# Altium schematic sheet UC3842原理图.SchDoc (part 2 of 2)
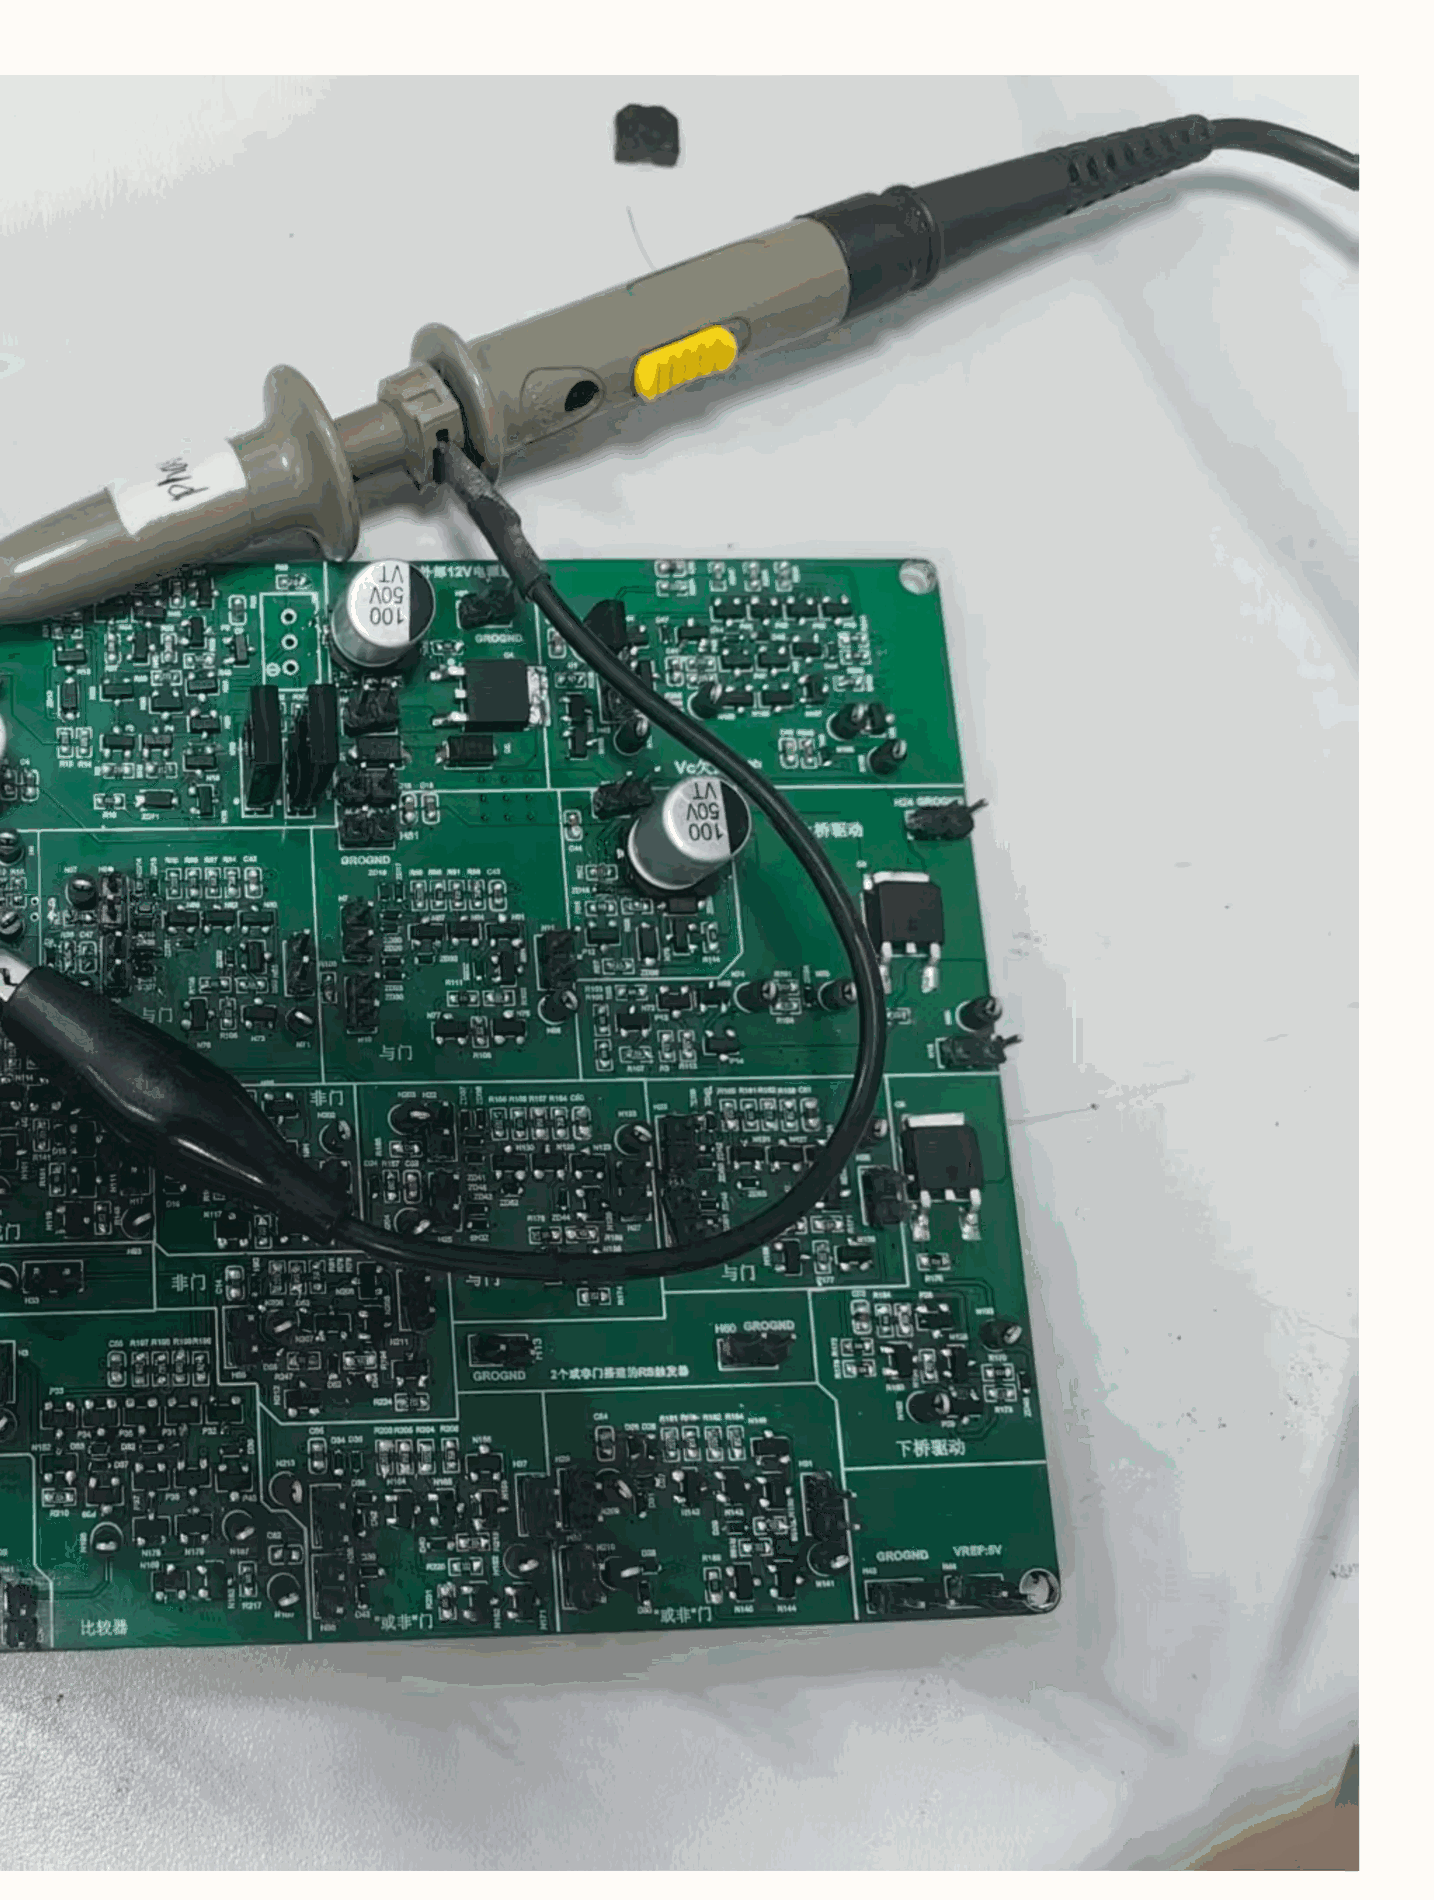
[diagram p10: UC3842原理图.SchDoc, bottom column 3 of 4]

## Nets
+VREF: C?#1.2 C?#2.2 C?#23.1 C?#24.1 C?#25.1 C?#27.2 C?#28.2 C?#31.2 C?#32.2 C?#33.2 C?#35.2 C?#36.2 C?#38.1 C?#39.2 C?#40.2 C?#46.2 C?#47.2 C?#48.2 C?#51.2 C?#52.2 C?#53.2 C?#54.2 C?#55.1 C?#56.1 C?#62.2 D?#5.2(K) D?#10.2(K) D?#11.2(K) D?#12.2(K) D?#13.2(K) D?#28.2(K) D?#29.2(K) D?#30.2(K) D?#42.2(K) D?#43.2(K) H?#1.1 H?#1.2 H?#16.2 H?#27.2 H?#57.2 H?#58.2 N?#74.3 N?#77.3 N?#78.3 N?#171.3 P?#21.2(E) P?#22.2(E) P?#45.2(E) Q?#9.2(E) R?#1.2 R?#2.2 R?#3.2 R?#4.2 R?#7.1 R?#8.2 R?#71.2 R?#72.2 R?#73.2 R?#74.2 R?#75.2 R?#76.2 R?#77.2 R?#79.2 R?#102.2 R?#103.2 R?#104.2 R?#105.2 R?#106.2 R?#107.2 R?#108.2 R?#109.2 R?#110.2 R?#111.2 R?#112.2 R?#113.2 R?#114.2 R?#115.2 R?#116.2 R?#117.2 R?#118.2 R?#119.2 R?#120.2 R?#121.2 R?#142.2 R?#143.2 R?#144.2 R?#145.2 R?#146.2 R?#148.2 R?#149.2 R?#150.2 R?#169.2 R?#170.2 R?#171.2 R?#172.2 R?#173.2 R?#174.2 R?#175.2 R?#176.1 R?#188.2 R?#190.2 R?#191.2 R?#192.2 R?#197.2 R?#198.2 R?#199.2 R?#200.2 R?#203.2 R?#204.2 R?#204.3 R?#209.1 R?#211.2 R?#212.2 U?#1.3(DRAIN) U?#2.3(DRAIN) ZD?#13.2(K) ZD?#14.2(K) ZD?#16.2(K) ZD?#17.2(K) ZD?#38.2(K) ZD?#39.2(K) ZD?#40.2(K) ZD?#41.2(K) ZD?#55.1(A) ZD?#62.2(K) ZD?#64.2(K)
COMP: C?#49.2 C?#50.2 COMP?#2.1 H?#9.1 H?#9.2 H?#48.1 N?#157.3 N?#160.3 N?#163.3 P?#36.3(C) R?#185.1 R?#186.1 ZD?#61.2(K)
GROGND: C?#1.1 C?#2.1 C?#3.2 C?#4.2 C?#7.2 C?#8.2 C?#9.2 C?#10.2 C?#11.2 C?#12.2 C?#13.2 C?#14.2 C?#15.2 C?#16.2 C?#17.2 C?#18.2 C?#20.2 C?#21.2 C?#22.2 C?#23.2 C?#24.2 C?#25.2 C?#27.1 C?#28.1 C?#29.1 C?#30.2 C?#31.1 C?#32.1 C?#33.1 C?#35.1 C?#36.1 C?#37.2 C?#38.2 C?#39.1 C?#40.1 C?#42.2 C?#44.1 C?#45.2 C?#46.1 C?#47.1 C?#48.1 C?#51.1 C?#52.1 C?#53.1 C?#54.1 C?#55.2 C?#56.2 C?#59.2 C?#60.2 C?#61.2 C?#62.1 D?#22.1(A) D?#23.1(A) D?#24.1(A) D?#25.1(A) D?#26.2(K) D?#37.1(A) D?#38.1(A) D?#39.1(A) D?#50.1(A) D?#51.1(A) H?#2.1 H?#2.2 H?#3.1 H?#3.2 H?#7.1 H?#7.2 H?#12.1 H?#12.2 H?#14.1 H?#14.2 H?#17.1 H?#17.2 H?#19.1 H?#19.2 H?#35.1 H?#35.2 H?#36.1 H?#36.2 H?#51.1 H?#51.2 N?#6.2 N?#8.2 N?#9.2 N?#13.2 N?#14.2 N?#24.2 N?#32.2 N?#39.2 N?#42.2 N?#43.2 N?#45.2 N?#48.2 N?#50.2 N?#67.2 N?#68.2 N?#70.2 N?#71.2 N?#84.2 N?#88.2 N?#99.2 N?#105.2 N?#106.2 N?#107.2 N?#108.2 N?#114.2 N?#116.2 N?#117.2 N?#119.2 N?#133.2 N?#134.2 N?#137.2 N?#138.2 N?#139.2 N?#149.2 N?#152.2 N?#153.2 N?#154.2 N?#161.2 N?#163.2 N?#175.2 N?#176.2 N?#179.2 N?#182.2 N?#184.2 N?#186.2 N?#187.2 N?#190.2 N?#192.2 N?#193.2 N?#195.2 N?#196.2 N?#199.2 P?#8.3(C) P?#9.3(C) P?#16.3(C) P?#17.3(C) P?#23.3(C) P?#29.3(C) P?#31.3(C) P?#32.3(C) P?#35.3(C) P?#46.3(C) P?#47.3(C) P?#48.3(C) Q?#3.2 Q?#4.2 Q?#6.3(S) R?#6.1 R?#10.1 R?#13.1 R?#47.1 R?#49.1 R?#54.1 R?#58.1 R?#59.1 R?#60.1 R?#63.1 R?#64.1 R?#65.1 R?#66.1 R?#67.1 R?#68.1 R?#69.1 R?#70.1 R?#94.2 R?#95.2 R?#127.1 R?#138.1 R?#139.1 R?#140.1 R?#141.1 R?#147.1 R?#152.1 R?#163.2 R?#165.1 R?#168.2 R?#179.2 R?#187.2 R?#195.2 R?#202.1 R?#205.1 R?#220.2 R?#221.2 R?#226.1 R?#227.1 R?#228.1 ZD?#9.2 ZD?#11.2 ZD?#12.2 ZD?#25.2(K) ZD?#26.1(A) ZD?#27.1(A) ZD?#29.1(A) ZD?#30.1(A) ZD?#31.2(K) ZD?#37.1(A) ZD?#49.2(K) ZD?#50.1(A) ZD?#51.1(A) ZD?#52.1(A) ZD?#53.1(A) ZD?#54.2(K) ZD?#60.2 ZD?#61.1(A) ZD?#63.1(A)
VC: C?#7.1 C?#8.1 C?#29.2 C?#44.2 D?#6.2(K) D?#7.2(K) H?#18.1 N?#15.1 N?#127.3 P?#34.2(E) R?#11.2 R?#18.2 R?#24.2 R?#151.1
VCC: C?#5.1 C?#6.1 C?#9.1 C?#10.1 H?#6.1 H?#6.2 N?#11.1 Q?#1.2(S) R?#23.2 R?#33.2 R?#36.2 ZD?#1.1 ZD?#2.1 ZD?#3.1
VFB: COMP?#3.1 H?#8.1 H?#8.2 N?#157.1 N?#158.2 R?#189.1
CUR: H?#58.1 R?#217.1
FAULT: C?#3.1 D?#5.1(A) H?#21.1 H?#38.1 N?#5.1 N?#8.3 R?#7.2 R?#9.1 ZD?#65.2(K)
Iout1: H?#5.2 N?#1.1
Iout2: H?#61.2 N?#162.1
ISENSES: H?#10.1 H?#10.2 N?#194.1 R?#218.2 R?#223.1
RT/CT: H?#54.1 N?#172.1
VOT: H?#57.1 R?#216.1
VOUT: C?#34.2 H?#4.1 H?#4.2 N?#72.2 N?#73.1 P?#20.3(C) Q?#5.3(S) Q?#6.2(D) R?#98.2 R?#99.1 R?#101.2 ZD?#32.2
NetC?#4_1: C?#4.1 D?#4.1(A) N?#7.1 P?#8.1(B) R?#11.1 R?#13.2
NetC?#5_2: C?#5.2 R?#12.2
NetC?#6_2: C?#6.2 D?#8.2(K) N?#26.1 P?#15.1(B) Q?#3.3 Q?#4.3 R?#36.1
NetC?#11_1: C?#11.1 N?#12.1 P?#10.3 Q?#1.3(D) R?#12.1 R?#19.2 ZD?#6.2(K) ZD?#8.2(K)
NetC?#12_1: C?#12.1 C?#13.1 C?#14.1 N?#10.1 N?#17.2(C) N?#19.2(C) R?#14.1 R?#15.1 R?#16.2 R?#17.2 R?#20.2 R?#21.2 R?#22.2
NetC?#15_1: C?#15.1 C?#16.1 H?#15.1 N?#22.2 N?#27.1 N?#31.3 R?#35.2 R?#37.2 R?#44.1 ZD?#6.1(A)
NetC?#17_1: C?#17.1 C?#18.1 N?#16.1 N?#20.2(C) N?#23.2(C) R?#18.1 R?#24.1 R?#25.2 R?#26.2 R?#29.2 R?#30.2 R?#31.2
NetC?#19_1: C?#19.1 N?#41.1 N?#44.3 R?#56.1
NetC?#19_2: C?#19.2 N?#41.3 N?#45.3 P?#16.1(B) R?#48.1
NetC?#20_1: C?#20.1 N?#36.1 Q?#3.1 R?#38.1 R?#58.2
NetC?#21_1: C?#21.1 N?#37.1 P?#15.3(C) Q?#4.1 R?#59.2
NetC?#22_1: C?#22.1 D?#8.1(A) N?#28.1 R?#33.1 ZD?#10.1
NetC?#26_1: C?#26.1 N?#47.1 N?#49.3 R?#62.1
NetC?#26_2: C?#26.2 N?#47.3 N?#50.3 P?#17.1(B) R?#53.1
NetC?#30_1: C?#30.1 D?#9.1(A) H?#22.1 N?#59.1 R?#86.1
NetC?#34_1: C?#34.1 P?#18.2(E) R?#82.2 ZD?#15.2(K)
NetC?#37_1: C?#37.1 N?#84.1 R?#124.2 R?#127.2
NetC?#41_1: C?#41.1 P?#32.1(B) ZD?#33.2(K) ZD?#36.1(A)
NetC?#41_2: C?#41.2 C?#43.2 R?#141.2 ZD?#37.2(K)
NetC?#42_1: C?#42.1 N?#92.1 N?#93.1 R?#118.1 R?#131.2
NetC?#43_1: C?#43.1 H?#34.1 H?#34.2
NetC?#45_1: C?#45.1 D?#27.1(A) H?#39.1 N?#128.1 R?#155.1
NetC?#49_1: C?#49.1 R?#189.2 R?#189.3
NetC?#50_1: C?#50.1 N?#158.1 N?#158.3 N?#159.1 N?#160.1 N?#195.3 Q?#8.3(C) ZD?#63.2(K)
NetC?#57_1: C?#57.1 N?#175.1 N?#180.3 N?#181.3 R?#208.1
NetC?#57_2: C?#57.2 N?#175.3 R?#207.1
NetC?#58_1: C?#58.1 N?#171.2
NetC?#58_2: C?#58.2 R?#219.2 R?#219.3
NetC?#59_1: C?#59.1 N?#183.1 R?#212.1 ZD?#64.1(A) ZD?#66.1
NetC?#60_1: C?#60.1 D?#49.2(K) N?#185.1 P?#45.3(C) R?#204.1 R?#227.2 ZD?#62.1(A) ZD?#65.1(A) ZD?#67.1(A) ZD?#68.1(A)
NetC?#61_1: C?#61.1 H?#59.2 H?#60.1 N?#191.1 R?#223.2
NetCOMP?#1_1: COMP?#1.1 P?#36.2(E) R?#176.2
NetD?#1_1: D?#1.1(A) P?#3.3(C)
NetD?#1_2: D?#1.2(K) D?#3.2(K) P?#6.1(B) P?#9.2(E)
NetD?#2_1: D?#2.1(A) P?#2.3(C)
NetD?#2_2: D?#2.2(K) D?#4.2(K) P?#7.1(B) P?#8.2(E)
NetD?#3_1: D?#3.1(A) N?#4.1 P?#9.1(B) R?#8.1 R?#9.2 R?#10.2
NetD?#6_1: D?#6.1(A) H?#13.1 H?#13.2 Q?#2.1(G) R?#47.2
NetD?#7_1: D?#7.1(A) Q?#2.2(D)
NetD?#9_2: D?#9.2(K) H?#32.2 H?#44.1 R?#81.2 R?#86.2
NetD?#10_1: D?#10.1(A) D?#21.2(K) D?#23.2(K) H?#33.2
NetD?#11_1: D?#11.1(A) D?#17.2(K) D?#24.2(K) H?#30.2
NetD?#12_1: D?#12.1(A) D?#14.2(K) D?#25.2(K) H?#28.2
NetD?#13_1: D?#13.1(A) D?#19.2(K) D?#22.2(K) H?#31.2 N?#90.1
NetD?#14_1: D?#14.1(A) N?#81.1 N?#112.1 R?#104.1
NetD?#15_1: D?#15.1 H?#30.1 N?#86.1 N?#88.3
NetD?#15_2: D?#15.2 R?#119.1
NetD?#16_1: D?#16.1(A) N?#80.2 N?#85.1 R?#129.2
NetD?#16_2: D?#16.2(K) D?#20.2(K) N?#80.1 N?#91.3 R?#113.1
NetD?#17_1: D?#17.1(A) N?#111.1 R?#109.1
NetD?#18_1: D?#18.1(A) N?#75.2 N?#82.1 R?#128.2
NetD?#18_2: D?#18.2(K) N?#75.1 N?#98.3 R?#106.1
NetD?#19_1: D?#19.1(A) N?#91.1 R?#112.1
NetD?#20_1: D?#20.1(A) H?#32.1 N?#85.2 N?#94.1 N?#106.3 R?#129.1
NetD?#21_1: D?#21.1(A) N?#103.1 N?#110.1 R?#110.1
NetD?#26_1: D?#26.1(A) N?#110.2 N?#111.2 N?#112.2
NetD?#27_2: D?#27.2(K) H?#45.2 R?#153.2 R?#155.2
NetD?#28_1: D?#28.1(A) D?#32.2(K) D?#37.2(K) H?#44.2 N?#143.1
NetD?#29_1: D?#29.1(A) D?#33.2(K) D?#39.2(K) H?#43.2 N?#145.1
NetD?#30_1: D?#30.1(A) D?#35.2(K) D?#38.2(K) H?#46.2 N?#147.1
NetD?#31_1: D?#31.1(A) N?#140.2 N?#141.1 R?#177.2
NetD?#31_2: D?#31.2(K) D?#34.2(K) N?#140.1 N?#144.3 R?#170.1
NetD?#32_1: D?#32.1(A) N?#144.1 R?#169.1
NetD?#33_1: D?#33.1(A) N?#150.1 R?#172.1
NetD?#34_1: D?#34.1(A) H?#45.1 N?#141.2 N?#149.3 R?#177.1
NetD?#35_1: D?#35.1(A) N?#151.1 R?#173.1
NetD?#36_1: D?#36.1(A) N?#142.2 N?#146.1 R?#178.1
NetD?#36_2: D?#36.2(K) N?#142.1 N?#150.3 N?#151.3 R?#174.1
NetD?#40_1: D?#40.1(A) P?#42.3(C)
NetD?#40_2: D?#40.2(K) D?#44.2(K) P?#43.1(B) P?#47.2(E)
NetD?#41_1: D?#41.1(A) P?#41.3(C)
NetD?#41_2: D?#41.2(K) D?#45.2(K) P?#44.1(B) P?#46.2(E)
NetD?#42_1: D?#42.1(A) D?#47.2(K) D?#51.2(K) H?#55.2
NetD?#43_1: D?#43.1(A) D?#46.2(K) D?#50.2(K) H?#53.2 N?#169.1
NetD?#44_1: D?#44.1(A) H?#49.2 N?#168.1 P?#47.1(B)
NetD?#45_1: D?#45.1(A) H?#59.1 N?#167.1 P?#46.1(B)
NetD?#46_1: D?#46.1(A) N?#177.1 R?#197.1
NetD?#47_1: D?#47.1(A) N?#178.1 R?#198.1
NetD?#48_1: D?#48.1(A) N?#166.2 N?#170.1 R?#213.1
NetD?#48_2: D?#48.2(K) N?#166.1 N?#177.3 N?#178.3 R?#199.1
NetD?#49_1: D?#49.1(A) P?#48.1(B)
NetH?#5_1: H?#5.1 N?#2.1 N?#3.1 N?#3.3 R?#5.1 U?#1.1(GATE)
NetH?#11_1: H?#11.1 P?#10.2 R?#27.2
NetH?#11_2: H?#11.2 R?#14.2 R?#15.2
NetH?#15_2: H?#15.2 Q?#2.3(S)
NetH?#16_1: H?#16.1 N?#25.2 N?#30.1 N?#35.3 R?#42.2 R?#43.2 R?#46.3 ZD?#8.1(A)
NetH?#18_2: H?#18.2 Q?#5.2(D) R?#78.2
NetH?#20_1: H?#20.1 N?#53.1 R?#81.1
NetH?#20_2: H?#20.2 ZD?#13.1(A) ZD?#18.2(K) ZD?#26.2(K)
NetH?#21_2: H?#21.2 ZD?#16.1(A) ZD?#19.2(K) ZD?#29.2(K)
NetH?#22_2: H?#22.2 ZD?#14.1(A) ZD?#20.2(K) ZD?#27.2(K)
NetH?#23_1: H?#23.1 N?#55.2 N?#67.3 R?#87.1
NetH?#23_2: H?#23.2 N?#61.1 R?#88.2
NetH?#24_1: H?#24.1 R?#88.1
NetH?#24_2: H?#24.2 ZD?#17.1(A) ZD?#22.2(K) ZD?#30.2(K)
NetH?#25_1: H?#25.1 N?#57.2 N?#63.1 N?#68.3 R?#90.1
NetH?#25_2: H?#25.2 R?#91.2
NetH?#26_1: H?#26.1 N?#69.1 N?#84.3 R?#117.1
NetH?#26_2: H?#26.2 H?#28.1 H?#43.1
NetH?#27_1: H?#27.1 N?#78.1
NetH?#29_1: H?#29.1 N?#77.2 N?#99.3 P?#28.2(E) R?#123.1
NetH?#29_2: H?#29.2 N?#83.1 R?#124.1
NetH?#31_1: H?#31.1 N?#82.2 N?#89.1 N?#107.3 R?#128.1
NetH?#33_1: H?#33.1 H?#47.2 H?#53.1
NetH?#37_1: H?#37.1 N?#122.1 R?#153.1
NetH?#37_2: H?#37.2 ZD?#38.1(A) ZD?#42.2(K) ZD?#50.2(K)
NetH?#38_2: H?#38.2 ZD?#40.1(A) ZD?#43.2(K) ZD?#52.2(K)
NetH?#39_2: H?#39.2 ZD?#39.1(A) ZD?#44.2(K) ZD?#51.2(K)
NetH?#40_1: H?#40.1 N?#124.2 N?#134.3 R?#156.1
NetH?#40_2: H?#40.2 N?#130.1 R?#157.2
NetH?#41_1: H?#41.1 R?#157.1
NetH?#41_2: H?#41.2 ZD?#41.1(A) ZD?#46.2(K) ZD?#53.2(K)
NetH?#42_1: H?#42.1 N?#126.2 N?#132.1 N?#137.3 R?#158.1
NetH?#42_2: H?#42.2 R?#159.2
NetH?#46_1: H?#46.1 H?#56.2
NetH?#47_1: H?#47.1 N?#146.2 N?#148.1 N?#153.3 R?#178.2
NetH?#48_2: H?#48.2 H?#50.1 N?#155.1 N?#187.3 P?#48.2(E) ZD?#58.1(A) ZD?#67.2(K)
NetH?#49_1: H?#49.1 N?#156.1 R?#184.1 R?#187.1 ZD?#60.1
NetH?#50_2: H?#50.2 P?#37.2(E) R?#193.2
NetH?#52_1: H?#52.1 H?#52.2 R?#194.2
NetH?#54_2: H?#54.2 N?#171.1
NetH?#55_1: H?#55.1 N?#173.1 N?#176.3 R?#211.1
NetH?#56_1: H?#56.1 N?#170.2 N?#174.1 N?#186.3 R?#213.2
NetH?#60_2: H?#60.2 R?#219.1
NetH?#61_1: H?#61.1 N?#197.1 N?#198.1 N?#198.3 R?#229.1 U?#2.1(GATE)
NetN?#1_2: N?#1.2 R?#6.2
NetN?#1_3: N?#1.3 P?#1.1(B) P?#2.1(B) P?#3.1(B) P?#4.1(B) P?#5.1(B) P?#5.3(C)
NetN?#3_2: N?#3.2 N?#6.1 N?#6.3
NetN?#8_1: N?#8.1 N?#9.3 P?#4.3(C)
NetN?#9_1: N?#9.1 N?#14.3 P?#6.3(C)
NetN?#13_1: N?#13.1 N?#13.3 N?#14.1 P?#7.3(C)
NetN?#17_1: N?#17.1(B) N?#22.3 N?#39.3 P?#12.3(C) P?#16.2(E) R?#48.2
NetN?#17_3: N?#17.3(E) N?#19.1(B) N?#19.3(E) R?#34.1 R?#35.1 R?#37.1
NetN?#18_1: N?#18.1 R?#20.1 ZD?#11.1
NetN?#18_2: N?#18.2 R?#40.2
NetN?#18_3: N?#18.3 R?#21.1
NetN?#20_1: N?#20.1(B) N?#25.3 N?#42.3 P?#14.3(C) P?#17.2(E) R?#53.2
NetN?#20_3: N?#20.3(E) N?#23.1(B) N?#23.3(E) R?#41.1 R?#42.1 R?#43.1
NetN?#21_1: N?#21.1 R?#29.1 ZD?#12.1
NetN?#21_2: N?#21.2 R?#45.2
NetN?#21_3: N?#21.3 R?#30.1
NetN?#22_1: N?#22.1 R?#34.2 ZD?#4.2
NetN?#24_1: N?#24.1 ZD?#5.2
NetN?#24_3: N?#24.3 R?#28.1 ZD?#9.1
NetN?#25_1: N?#25.1 R?#41.2 ZD?#7.2
NetN?#27_2: N?#27.2 N?#34.3
NetN?#27_3: N?#27.3 N?#29.3 P?#11.1(B) P?#11.3(C) P?#12.1(B)
NetN?#29_1: N?#29.1 R?#40.1 R?#50.2
NetN?#29_2: N?#29.2 N?#34.2 N?#40.3 R?#51.1 R?#56.2 R?#57.2
NetN?#30_2: N?#30.2 N?#38.3
NetN?#30_3: N?#30.3 N?#33.3 P?#13.1(B) P?#13.3(C) P?#14.1(B)
NetN?#31_1: N?#31.1 R?#44.2 R?#44.3 R?#54.2
NetN?#31_2: N?#31.2 N?#34.1 R?#51.2
NetN?#32_1: N?#32.1 R?#49.2 ZD?#10.2
NetN?#32_3: N?#32.3 R?#39.1
NetN?#33_1: N?#33.1 R?#45.1 R?#52.2
NetN?#33_2: N?#33.2 N?#38.2 N?#46.3 R?#55.1 R?#61.2 R?#62.2
NetN?#35_1: N?#35.1 R?#46.1 R?#46.2 R?#60.2
NetN?#35_2: N?#35.2 N?#38.1 R?#55.2
NetN?#39_1: N?#39.1 R?#50.1 R?#63.2
NetN?#40_1: N?#40.1 N?#43.3 R?#57.1
NetN?#40_2: N?#40.2 N?#43.1 N?#44.1 R?#64.2
NetN?#41_2: N?#41.2 N?#45.1 R?#66.2
NetN?#42_1: N?#42.1 R?#52.1 R?#67.2
NetN?#44_2: N?#44.2 R?#65.2
NetN?#46_1: N?#46.1 N?#48.3 R?#61.1
NetN?#46_2: N?#46.2 N?#48.1 N?#49.1 R?#68.2
NetN?#47_2: N?#47.2 N?#50.1 R?#70.2
NetN?#49_2: N?#49.2 R?#69.2
NetN?#51_1: N?#51.1 N?#54.3 R?#73.1 ZD?#21.2(K)
NetN?#51_2: N?#51.2 N?#55.1 R?#87.2 ZD?#21.1(A)
NetN?#51_3: N?#51.3 N?#55.3 R?#71.1
NetN?#52_1: N?#52.1 N?#56.3 R?#77.1 ZD?#24.2(K)
NetN?#52_2: N?#52.2 N?#57.1 R?#90.2 ZD?#24.1(A)
NetN?#52_3: N?#52.3 N?#57.3 R?#75.1
NetN?#54_1: N?#54.1 N?#60.3 R?#72.1
NetN?#54_2: N?#54.2 N?#67.1 R?#93.1 R?#97.1
NetN?#56_1: N?#56.1 N?#62.3 R?#76.1
NetN?#56_2: N?#56.2 N?#68.1 R?#96.1 R?#100.1
NetN?#58_1: N?#58.1 P?#19.3(C) P?#20.1(B) R?#98.1
NetN?#58_2: N?#58.2 N?#66.1 P?#20.2(E) R?#89.1 R?#92.1
NetN?#58_3: N?#58.3 P?#18.3(C) P?#19.2(E) R?#80.1 R?#84.1
NetN?#60_1: N?#60.1 R?#74.1 ZD?#18.1(A) ZD?#20.1(A)
NetN?#60_2: N?#60.2 ZD?#25.1(A)
NetN?#62_1: N?#62.1 R?#79.1 ZD?#19.1(A) ZD?#22.1(A)
NetN?#62_2: N?#62.2 ZD?#31.1(A)
NetN?#64_1: N?#64.1 Q?#5.1(G) R?#92.2 R?#99.2 ZD?#23.1(A)
NetN?#65_1: N?#65.1 R?#91.1 R?#94.1
NetN?#65_2: N?#65.2 R?#95.1
NetN?#65_3: N?#65.3 R?#83.2
NetN?#70_1: N?#70.1 R?#97.2
NetN?#70_3: N?#70.3 R?#93.2
NetN?#71_1: N?#71.1 R?#100.2
NetN?#71_3: N?#71.3 R?#96.2
NetN?#72_1: N?#72.1 R?#101.1 ZD?#28.2
NetN?#72_3: N?#72.3 R?#85.2 ZD?#32.1
NetN?#74_1: N?#74.1 N?#79.3 P?#28.1(B) P?#28.3(C) R?#115.1
NetN?#74_2: N?#74.2 N?#77.1 R?#123.2
NetN?#75_3: N?#75.3 N?#82.3 R?#102.1
NetN?#76_1: N?#76.1 N?#79.1 N?#105.3 P?#22.3(C) R?#126.2
NetN?#78_2: N?#78.2 ZD?#34.1(A)
NetN?#79_2: N?#79.2 R?#130.2 R?#136.2 R?#140.2
NetN?#80_3: N?#80.3 N?#85.3 R?#114.1
NetN?#87_1: N?#87.1 N?#102.3 R?#121.1 ZD?#35.1
NetN?#88_1: N?#88.1 ZD?#35.2
NetN?#91_2: N?#91.2 N?#106.1 R?#132.2 R?#134.2
NetN?#92_2: N?#92.2 N?#100.1
NetN?#92_3: N?#92.3 N?#100.3 P?#23.1(B) P?#24.1(B) P?#24.3(C)
NetN?#95_1: N?#95.1 R?#122.1 RTCT?.1 ZD?#36.2(K)
NetN?#95_2: N?#95.2 N?#104.1
NetN?#95_3: N?#95.3 N?#104.3 P?#25.1(B) P?#25.3(C) P?#26.1(B)
NetN?#96_1: N?#96.1 N?#96.3 P?#33.2(E) R?#125.1
NetN?#96_2: N?#96.2 N?#105.1 N?#108.3
NetN?#97_1: N?#97.1 N?#98.1 N?#110.3 N?#111.3 N?#112.3 R?#105.1
NetN?#98_2: N?#98.2 N?#107.1 R?#133.2 R?#137.1
NetN?#99_1: N?#99.1 R?#130.1
NetN?#100_2: N?#100.2 N?#104.2 R?#138.2
NetN?#101_1: N?#101.1 N?#102.1 N?#113.3 R?#120.1
NetN?#102_2: N?#102.2 N?#113.2 R?#152.2
NetN?#108_1: N?#108.1 N?#117.3 P?#26.3(C) R?#126.1
NetN?#109_1: N?#109.1 P?#31.1(B) R?#131.1 R?#139.2
NetN?#113_1: N?#113.1 ZD?#34.2(K)
NetN?#114_1: N?#114.1 R?#134.1
NetN?#114_3: N?#114.3 R?#132.1
NetN?#115_1: N?#115.1 R?#135.1
NetN?#116_1: N?#116.1 R?#137.2
NetN?#116_3: N?#116.3 R?#133.1
NetN?#117_1: N?#117.1 P?#30.3(C) R?#147.2
NetN?#118_1: N?#118.1 N?#119.3 R?#116.1 R?#122.2 R?#122.3 ZD?#33.1(A)
NetN?#119_1: N?#119.1 P?#33.3(C) R?#136.1
NetN?#120_1: N?#120.1 N?#123.3 R?#145.1 ZD?#45.2(K)
NetN?#120_2: N?#120.2 N?#124.1 R?#156.2 ZD?#45.1(A)
NetN?#120_3: N?#120.3 N?#124.3 R?#142.1
NetN?#121_1: N?#121.1 N?#125.3 R?#150.1 ZD?#47.2(K)
NetN?#121_2: N?#121.2 N?#126.1 R?#158.2 ZD?#47.1(A)
NetN?#121_3: N?#121.3 N?#126.3 R?#146.1
NetN?#123_1: N?#123.1 N?#129.3 R?#144.1
NetN?#123_2: N?#123.2 N?#134.1 R?#162.1 R?#166.1
NetN?#125_1: N?#125.1 N?#131.3 R?#149.1
NetN?#125_2: N?#125.2 N?#137.1 R?#164.1 R?#167.1
NetN?#127_2: N?#127.2 N?#135.1 P?#35.2(E) R?#160.1 R?#161.1
NetN?#129_1: N?#129.1 R?#143.1 ZD?#42.1(A) ZD?#44.1(A)
NetN?#129_2: N?#129.2 ZD?#49.1(A)
NetN?#131_1: N?#131.1 R?#148.1 ZD?#43.1(A) ZD?#46.1(A)
NetN?#131_2: N?#131.2 ZD?#54.1(A)
NetN?#133_1: N?#133.1 R?#159.1 R?#163.1
NetN?#133_3: N?#133.3 R?#154.2
NetN?#136_1: N?#136.1 Q?#6.1(G) R?#161.2 R?#165.2 ZD?#48.1(A)
NetN?#138_1: N?#138.1 R?#166.2
NetN?#138_3: N?#138.3 R?#162.2
NetN?#139_1: N?#139.1 R?#167.2
NetN?#139_3: N?#139.3 R?#164.2
NetN?#140_3: N?#140.3 N?#141.3 R?#171.1
NetN?#142_3: N?#142.3 N?#146.3 R?#175.1
NetN?#144_2: N?#144.2 N?#149.1 R?#180.2 R?#181.2
NetN?#150_2: N?#150.2 N?#151.2 N?#153.1 R?#182.2 R?#183.1
NetN?#152_1: N?#152.1 R?#181.1
NetN?#152_3: N?#152.3 R?#180.1
NetN?#154_1: N?#154.1 R?#183.2
NetN?#154_3: N?#154.3 R?#182.1
NetN?#157_2: N?#157.2 N?#164.1 R?#201.1
NetN?#160_2: N?#160.2 R?#196.1
NetN?#161_1: N?#161.1 P?#37.3(C) R?#194.1 R?#195.1
NetN?#161_3: N?#161.3 P?#37.1(B) R?#193.1
NetN?#162_2: N?#162.2 R?#205.2
NetN?#162_3: N?#162.3 P?#38.1(B) P?#39.1(B) P?#40.1(B) P?#40.3(C) P?#41.1(B) P?#42.1(B)
NetN?#163_1: N?#163.1 R?#196.2 R?#202.2
NetN?#164_2: N?#164.2 R?#207.2
NetN?#164_3: N?#164.3 Q?#7.1(B) Q?#7.3(C) Q?#8.1(B)
NetN?#165_1: N?#165.1 P?#45.1(B) R?#203.1 R?#214.2
NetN?#166_3: N?#166.3 N?#170.3 R?#200.1
NetN?#176_1: N?#176.1 N?#182.3 P?#39.3(C)
NetN?#177_2: N?#177.2 N?#178.2 N?#186.1 R?#222.2 R?#225.1
NetN?#179_1: N?#179.1 N?#179.3 N?#180.1 N?#181.1 R?#210.1 R?#224.2
NetN?#180_2: N?#180.2 N?#181.2 R?#228.2
NetN?#182_1: N?#182.1 N?#193.3 P?#43.3(C)
NetN?#184_1: N?#184.1 R?#226.2 ZD?#66.2
NetN?#184_3: N?#184.3 R?#214.1
NetN?#187_1: N?#187.1 N?#188.1 R?#216.2 R?#220.1
NetN?#189_1: N?#189.1 N?#190.1 R?#217.2 R?#221.1
NetN?#190_3: N?#190.3 R?#215.2 ZD?#68.2(K)
NetN?#192_1: N?#192.1 N?#192.3 N?#193.1 P?#44.3(C)
NetN?#195_1: N?#195.1 R?#224.1
NetN?#196_1: N?#196.1 R?#225.2
NetN?#196_3: N?#196.3 R?#222.1
NetN?#198_2: N?#198.2 N?#199.1 N?#199.3
NetP?#1_2: P?#1.2(E) R?#2.1
NetP?#1_3: P?#1.3(C) P?#6.2(E) P?#7.2(E)
NetP?#2_2: P?#2.2(E) P?#3.2(E) R?#4.1
NetP?#4_2: P?#4.2(E) R?#3.1
NetP?#5_2: P?#5.2(E) R?#1.1
NetP?#10_1: P?#10.1 R?#19.1 R?#28.2
NetP?#11_2: P?#11.2(E) R?#16.1
NetP?#12_2: P?#12.2(E) R?#17.1
NetP?#13_2: P?#13.2(E) R?#26.1
NetP?#14_2: P?#14.2(E) R?#25.1
NetP?#15_2: P?#15.2(E) R?#32.1
NetP?#18_1: P?#18.1(B) R?#82.1 R?#85.1
NetP?#19_1: P?#19.1(B) R?#80.2 R?#83.1
NetP?#21_1: P?#21.1(B) P?#21.3(C) P?#22.1(B) P?#27.1(B) R?#125.2
NetP?#23_2: P?#23.2(E) P?#26.2(E) R?#103.1
NetP?#24_2: P?#24.2(E) R?#108.1
NetP?#25_2: P?#25.2(E) R?#107.1
NetP?#27_2: P?#27.2(E) R?#111.1
NetP?#27_3: P?#27.3(C) P?#29.2(E) P?#30.2(E)
NetP?#29_1: P?#29.1(B) P?#31.2(E)
NetP?#30_1: P?#30.1(B) P?#32.2(E)
NetP?#33_1: P?#33.1(B) R?#135.2
NetP?#34_1: P?#34.1(B) R?#151.2 R?#154.1
NetP?#34_3: P?#34.3(C) P?#35.1(B) R?#168.1
NetP?#36_1: P?#36.1(B) R?#179.1 ZD?#57.2(K)
NetP?#38_2: P?#38.2(E) R?#192.1
NetP?#38_3: P?#38.3(C) P?#43.2(E) P?#44.2(E)
NetP?#39_2: P?#39.2(E) R?#188.1
NetP?#40_2: P?#40.2(E) R?#190.1
NetP?#41_2: P?#41.2(E) P?#42.2(E) R?#191.1
NetQ?#1_1: Q?#1.1(G) R?#23.1 R?#39.2 ZD?#1.2
NetQ?#7_2: Q?#7.2(E) R?#185.2
NetQ?#8_2: Q?#8.2(E) R?#186.2
NetQ?#9_1: Q?#9.1(B) R?#209.2 R?#215.1
NetQ?#9_3: Q?#9.3(C) R?#218.1
NetR?#5_2: R?#5.2 U?#1.2(SOURCE)
NetR?#22_1: R?#22.1 ZD?#4.1
NetR?#27_1: R?#27.1 ZD?#5.1
NetR?#31_1: R?#31.1 ZD?#7.1
NetR?#32_2: R?#32.2 ZD?#2.2
NetR?#38_2: R?#38.2 ZD?#3.2
NetR?#78_1: R?#78.1 ZD?#15.1(A)
NetR?#84_2: R?#84.2 ZD?#28.1
NetR?#89_2: R?#89.2 ZD?#23.2(K)
NetR?#160_2: R?#160.2 ZD?#48.2(K)
NetR?#184_2: R?#184.2 ZD?#59.2(K)
NetR?#201_2: R?#201.2 R?#206.2 R?#210.2
NetR?#206_1: R?#206.1 R?#208.2
NetR?#229_2: R?#229.2 U?#2.2(SOURCE)
NetZD?#55_2: ZD?#55.2(K) ZD?#56.1(A)
NetZD?#56_2: ZD?#56.2(K) ZD?#57.1(A)
NetZD?#58_2: ZD?#58.2(K) ZD?#59.1(A)

Not connected (* = marked no-connect by the designer): N?#127 1

## Notes on the sheet
- Vc欠压保护
- 恒流源
- (near H?#4) PWM输出
- (near H?#2) 电流环保护触电
- (near H?#6) 外部电源输入
- (near H?#8) 外部电阻分压2.5V
- 外置环路补偿
- (near H?#10) 电流环电压
- +
- (near P?#8) [N+]
- (near N?#4) -
- (near N?#4) [N-]
- (near R?#10) Vout​ =2.5V
- 小于12V时输出为：低电平
- 正常时输出为：高电平
- 输入过欠压保护
- (near C?#5) RC峰值吸收
- 双阈值电路
- Vout​ ≈2.84V
- 凡是有电感的地方都要给我进行电流复位
- 凡是有电容的地方都要给我进行电压复位
- (near N?#11) 15V~28V
- 输入过压有滞回，欠压无滞回
- 15V~18V
- 比较器偏置电路
- 不复位意味着你做的任何一个逻辑有可前能失交
- (near ZD?#2) 过压释放阈值
- 镜像电流源
- (near ZD?#3) 过压自锁阈值
- (near H?#13) 前提要大于内部电压
- (near H?#13) 外部源输入
- 隔离二极管
- (near ZD?#10) 抬升二极管
- Vbeq1
- GS是否需要连接
- PMOS能否反接
- 正常的电路设计不管是PMOS还是NMOS的GS必须加电阻
- 我们这个电路Gs增加电阻不行因为Vwai会直接经过Gs电阻到vc端
- 15V
- (near N?#34) Ic3
- Ic2
- (near R?#51) Vbeq2
- (near P?#16) Ic4
- (near R?#57) Ir
- (near R?#56) Ic4
- (near P?#17) Ic4
- (near R?#57) Ie1
- (near N?#40) Ie2
- (near C?#19) Vbeq3
- Ib3
- (near N?#41) Ic2
- (near N?#45) Ic3
- (near N?#43) Ic0
- (near N?#43) Ib1
- Ib2
- Ic1
- (near N?#47) Ic2
- (near N?#50) Ic3
- (near H?#18) 外部电源选择输入
- (near N?#69) PWM取反输出测试点
- τ = R × C = 1µs
- (near C?#34) 自举电容
- (near R?#116) 调节频率
- 触发器输出测试点
- 触发器比较输出
- (near N?#83) PWM输出测试点
- 0-0.7V
- (near N?#73) 浮地
- (near ZD?#33) 充电
- (near R?#122) 调节窄脉冲的宽度
- 放电
- 比较器输出
- (near P?#27) wilson电流镜
- (near H?#29) 输出
- (near N?#78) 施密特触发器输入
- (near R?#120) 低阈值分压电阻
- (near R?#121) 高阈值分压电阻
- PWM
- (near RTCT?) 三角波
- 比较器正端
- (near N?#93) 阈值测试点
- (near R?#126) 复位
- (near N?#88) 5V欠压逻辑信号输出
- Vref Good
- 外部时钟同步
- 阈值
- (near N?#92) 比较器负端
- (near R?#131) 2/3VCC
- (near P?#32) 触发
- (near P?#31) 比较器正端
- 欠压输出：高电平
- Q\
- (near N?#109) 触发测试点
- (near N?#109) 1/3VCC
- (near N?#115) 复位输出测试点
- 正常输出：低电平
- 修改二：加了一个电容
- (near R?#147) 比较输出
- (near N?#117) 触发比较器输出
- 复位
- (near N?#118) 放电
- (near R?#152) 高低阈值下分压电阻
- f
- 1
- F
- ≃
- (R1 + 2R2) * C
- 1.44
- 100Khz
- 系统框图
- (near C?#45) τ = R × C = 1µs
- 5.3V
- 此推挽电路（上N下P）优缺点：
- (near P?#35) 充电是射级跟随器
- (near P?#35) 充电电流越来越小
- (near P?#35) 放电电流越来越小
- (near P?#35) 缺点：充放电都不是很快
- (near P?#35) 优缺点：上下管子导通后会自锁
- C1
- 误差放大器同相输入未被引至一个引脚
- E/A 输出可在引脚 1 上提供（用于外部补偿）
- 而是在内部被施加偏压至 2.5V±2%。
- 最小工作电压为：1.8V
- Ri
- 外部分压
- 从而使用户能够控制转换器的闭环频率响应。
- 然后一个Vbe导通压降0.6V
- 基极电压会被钳位到1.8V
- 3*Vpn - Vbe
- (near H?#47) 取反输出
- Rd
- 基准电压
- -
- Ie =
- 1200R
- 最大占空比的限制通过稳压管来实现
- 工作电压为：2.5V~36V
- (near N?#155) 电压环测试点
- (near ZD?#58) Vmin = 1.4V
- (near ZD?#58) Vmax = 4.4V
- (near N?#156) 电压环测试点
- 比较器
- 74LS02"或非"门
- (near COMP?#3) 外部分压2.5V
- (near R?#189) 同相输入端
- (near N?#159) 放大器测试点
- 电压环软启动
- 0.7V
- (near R?#201) 反相输入端
- 第二阶段软启动
- R
- S
- Q
- 启动后电容掉电复位
- (near N?#172) 斜波补偿
- (near N?#167) 电流环
- (near N?#167) +
- [N+]
- [N-]
- (near N?#168) 电压环
- (near R?#211) 比较器输出上拉
- 阈值比较器
- 0
- 触发比较器
- 稳态比较输出
- 保持
- 第一阶段软启动
- (near H?#57) 外部触发
- (near H?#58) 外部触发
- 振荡器斜坡的一部分可以与电流检测信号进行电阻相加
- 以便为占空比超过50%的转换器提供斜坡补偿
- 不稳定
- (near ZD?#65) 初始上电通过电容电平下拉复位
- 5V电压建立后，立刻将将FAULT电压拉低
- (near P?#48) 初始上电拉电压外环
- (near D?#49) 电容电压越高PNP放大电流越小
- (near N?#187) 电压环保护触电
- (near R?#221) 电流环保护触电
- (near ZD?#68) 拉低软启电容确保保护后还能软起
- 启动后，需要再次复位
- (near C?#60) 软启电容
- 接检流电阻
- (near C?#61) RC滤波
- 2段软启动
- 电压环启动波形
- 这个三极管分为三个阶段
- 第一个阶段：恒流源的1mA电流全部从三极管走
- 第二个阶段：恒流源的1mA电流部分从三极管走
- 第三个阶段：恒流源的1mA电流不从三极管走
- RC<<T
- Labels drawn without touching a wire or pin: RT/CT

## Library data of the parts
C?#1 C?#2 C?#19 C?#26-C?#33 C?#35 C?#36 C?#39 C?#40 C?#44-C?#48 C?#51-C?#54 C?#62 = C0603: Capacitor; Value: 104; Published: 8-Jun-2000; LatestRevisionDate: 17-Jul-2002; LatestRevisionNote: Re-released for DXP Platform.; Publisher: Altium Limited
C?#3 C?#4 C?#61 = CAP_CC_SMD_4: 物料号: *; 物料描述: *
C?#5 C?#6 C?#10 C?#20 C?#21 C?#37 C?#59 C?#60 = CAP_CC_SMD_5: 物料号: *; 物料描述: *
C?#7 C?#8 C?#13-C?#15 C?#18 C?#24 C?#25 C?#38 C?#41-C?#43 C?#55 C?#58 = CAP_CC_SMD_3: 物料号: *; 物料描述: *
C?#9 C?#11 C?#12 C?#16 C?#17 C?#22 C?#23 C?#34 C?#56 = CAP_EC_1: 贴片铝电解电容（RVT1V101M0607）; Part Number: *; Brand: *
C?#49 C?#50 C?#57 = CAP_CC_SMD_2: 品牌: muRATA; Part Number: *; 供应商物料号: *; 型号规格: *
COMP?#1-COMP?#3 N?#2 N?#4 N?#5 N?#7 N?#10-N?#12 N?#15 N?#16 N?#26 N?#28 N?#36 N?#37 N?#53 N?#59 N?#61 N?#63 N?#64 N?#66 N?#69 N?#73 N?#76 N?#81 N?#83 N?#86 N?#87 N?#89 N?#90 N?#93 N?#94 N?#97 N?#101 N?#103 N?#109 N?#115 N?#118 N?#122 N?#128 N?#130 N?#132 N?#135 N?#136 N?#143 N?#145 N?#147 N?#148 N?#155 N?#156 N?#159 N?#165 N?#167-N?#169 N?#172-N?#174 N?#183 N?#185 N?#188 N?#189 N?#191 N?#194 N?#197 RTCT? = 测试点: value: *
D?#1-D?#5 D?#10-D?#14 D?#16-D?#26 D?#28-D?#51 = 1N4148WT: 二极管配置:独立式;整流电流:150mA;直流反向耐压(Vr):100V;正向压降(Vf):1.25V@150mA;反向恢复时间(Trr):4ns;; Manufacturer: R+O(宏嘉诚); Symbol: 1N4148WT_C7420320; AddInBom: yes; ModelId: 8f56a03db567494d8f4c9d12aa52a741; ModelName: SOD-523_L1.2-W0.8-H0.7-LS1.6; ModelTransform: 62.992,31.496,0,0,0,0,0,0,0; Voltage - DC Reverse(Vr): 100V; Current - Rectified: 150mA; Non-Repetitive Peak Forward Surge Current: 2A; Diode Configuration: 独立式; Pd - Power Dissipation: 150mW; Reverse Leakage Current (Ir): 1uA@75V; Reverse Recovery Time (trr): 4ns; Operating Junction Temperature Range: -55℃~+150℃; LCSC Part Name: 100V 150mA; SupplierPart: C7420320; ManufacturerPart: 1N4148WT; Supplier Footprint: SOD-523; JLCPCB Part Class: Extended Part; Datasheet: https://item.szlcsc.com/datasheet/1N4148WT/8397142.html; Supplier: LCSC; ConvertToPcb: yes; FootprintName: SOD-523_L1.2-W0.8-LS1.6-FD; Voltage - Forward(Vf@If): 1.25V@150mA
D?#6 D?#7 = ss34_c7420365: 二极管配置:独立式;正向压降(Vf):550mV@3A;直流反向耐压(Vr):40V;整流电流:3A;; Manufacturer: R+O(宏嘉诚); AddInBom: yes; ModelId: 7e24bebe6cd74171ae8c9de6fc5b78aa; ModelTransform: 198.4248,103.5431,0,180,0,0,-0.001,0,0; Diode Configuration: 独立式; Voltage - DC Reverse(Vr): 40V; Current - Rectified: 3A; Reverse Leakage Current (Ir): 200uA@40V; Symbol: SS34_C7420365; LCSC Part Name: 电压:40V 电流:3A; SupplierPart: C7420365; ManufacturerPart: SS34; Supplier Footprint: SMA(DO-214AC); JLCPCB Part Class: Extended Part; Datasheet: https://item.szlcsc.com/datasheet/SS34/8397187.html; Supplier: LCSC; ConvertToPcb: yes; FootprintName: SMA_L4.3-W2.6-LS5.0-FD; ModelName: SMA_L4.3-W2.6-LS5.0-FD; Voltage - Forward(Vf@If): 550mV@3A
D?#8 D?#9 D?#27 ZD?#6 ZD?#8 ZD?#13-ZD?#27 ZD?#29-ZD?#31 ZD?#33 ZD?#34 ZD?#36-ZD?#59 ZD?#61-ZD?#65 ZD?#67 ZD?#68 = 1N4148WT: 二极管配置:独立式;整流电流:150mA;直流反向耐压(Vr):100V;正向压降(Vf):1.25V@150mA;反向恢复时间(Trr):4ns;; Manufacturer: R+O(宏嘉诚); Symbol: 1N4148WT_C7420320; AddInBom: yes; ModelId: 8f56a03db567494d8f4c9d12aa52a741; ModelName: SOD-523_L1.2-W0.8-H0.7-LS1.6; ModelTransform: 62.992,31.496,0,0,0,0,0,0,0; Diode Configuration: 独立式; Pd - Power Dissipation: 150mW; Current - Rectified: 150mA; Voltage - DC Reverse(Vr): 100V; Non-Repetitive Peak Forward Surge Current: 2A; Reverse Leakage Current (Ir): 1uA@75V; Reverse Recovery Time (trr): 4ns; Operating Junction Temperature Range: -55℃~+150℃; LCSC Part Name: 100V 150mA; SupplierPart: C7420320; ManufacturerPart: 1N4148WT; Supplier Footprint: SOD-523; JLCPCB Part Class: Extended Part; Datasheet: https://item.szlcsc.com/datasheet/1N4148WT/8397142.html; Supplier: LCSC; ConvertToPcb: yes; FootprintName: SOD-523_L1.2-W0.8-LS1.6-FD; Voltage - Forward(Vf@If): 1.25V@150mA
D?#15 = DIO_LED: Brand: LED; Part Number: *
H?#1-H?#61 = pz254v-11-02p: 插针结构:1x2P;间距:2.54mm;行距:-;圆针/方针:方针;安装方式:直插;排数:单排;总PIN位数:2P;额定电流:3A;额定电压:250V;配合针长度:6mm;塑高:2.5mm;端接针长度:3mm;触头材质:黄铜;触头镀层:-;工作温度:-40℃~+105℃;颜色:黑色;; Manufacturer: XFCN(兴飞); AddInBom: yes; ModelId: e35305ec3aa84b66b849f914b715e73f; ModelName: HDR2.54-M-LI-1X2P; ModelTransform: 200,100,0,0,0,0,0,0,-118.11; Pin Structure: 1x2P; Pitch: 2.54mm; Circluar Pins/Square Pins: 方针; Current Rating: 3A; Voltage Rating (Max): 250V; Symbol: PZ254V-11-02P; LCSC Part Name: 1x2P 间距:2.54mm 方针 直插; SupplierPart: C492401; ManufacturerPart: PZ254V-11-02P; Supplier Footprint: 插件,P=2.54mm; JLCPCB Part Class: Extended Part; Datasheet: https://item.szlcsc.com/datasheet/PZ254V-11-02P/502957.html; Supplier: LCSC; ConvertToPcb: yes; FootprintName: HDR-TH_2P-P2.54-V-M; Row Spacing: -; Mounting Type: 直插; Number of Rows: 单排; Number of Pins: 2P; Length of Mating Pin: 6mm; Insulation Height: 2.5mm; Length of End Connection Pin: 3mm; Contact Material: 黄铜; Contact Plating: -; Operating Temperature: -40℃~+105℃; Color: 黑色
N?#17 N?#19 N?#20 N?#23 = 2sd882_c90797: 晶体管类型:NPN;集电极电流(Ic):3A;集射极击穿电压(Vceo):30V;耗散功率(Pd):12.5W;直流电流增益(hFE):100@1A,2V;; Manufacturer: ST(意法半导体); AddInBom: yes; ModelId: 5d8cc27ca8d54406b5fd11c1efd06fe1; ModelTransform: 299.212,104.724,0,180,0,0,0,7.874,-196.85; Current - Collector(Ic): 3A; Collector - Emitter Voltage VCEO: 30V; Pd - Power Dissipation: 12.5W; Transition frequency(fT): 100MHz; Current - Collector Cutoff: 100uA; Vce Saturation(VCE(sat)): 400mV; Symbol: 2SD882; LCSC Part Name: NPN 电流:3A 电压:30V; SupplierPart: C90797; ManufacturerPart: 2SD882; Supplier Footprint: TO-126; JLCPCB Part Class: Extended Part; Datasheet: https://item.szlcsc.com/datasheet/2SD882/91985.html; Supplier: LCSC; ConvertToPcb: yes; FootprintName: TO-126-3_L7.6-W2.7-P2.29-R; ModelName: TO-126-3_L7.6-W2.7-P2.29-R; type: NPN; DC Current Gain: 100@1A,2V; Operating Temperature: -65℃~+150℃
P?#10 = BJT_PNP: PNP/30V/3A; Part Number: *; Brand: *
Q?#1 = do4085a: 数量:1个P沟道;漏源电压(Vdss):40V;连续漏极电流(Id):5A;导通电阻(RDS(on)):90mΩ@10V;耗散功率(Pd):3.8W;阈值电压(Vgs(th)):2.5V;; Manufacturer: DOINGTER(杜因特); AddInBom: yes; ModelId: 89cb27a44ab2466697082bb9fd73a7d0; ModelName: SOT-23-3L_L2.9-W1.6-H1.1-LS2.8-P0.95; ModelTransform: 114.173,110.236,0,90,0,0,0,0,0; Number: 1个P沟道; Drain to Source Voltage: 40V; Current - Continuous Drain(Id): 5A; Pd - Power Dissipation: 3.8W; Gate Threshold Voltage (Vgs(th)): 2.5V; Gate Charge(Qg): 7nC@10V; Input Capacitance(Ciss): 570pF; Reverse Transfer Capacitance (Crss@Vds): 40pF; Type: P沟道; Output Capacitance(Coss): 50pF; Symbol: DO4085A; LCSC Part Name: P沟道MOSFET; SupplierPart: C47018569; ManufacturerPart: DO4085A; Supplier Footprint: SOT-23; JLCPCB Part Class: Extended Part; Datasheet: https://item.szlcsc.com/datasheet/DO4085A/49200335.html; Supplier: LCSC; ConvertToPcb: yes; FootprintName: SOT-23-3_L2.9-W1.6-P1.90-LS2.8-BR; RDS(on): 90mΩ@10V; Operating Temperature: -55℃~+150℃
Q?#2 = aod4185_c400894: 类型:1个P沟道;漏源电压(Vdss):40V;连续漏极电流(Id):40A;导通电阻(RDS(on)@Vgs,Id):20mΩ@4.5V,15A;功率(Pd):62.5W;阈值电压(Vgs(th)@Id):1.7V@250uA;; Manufacturer: AOS; AddInBom: yes; ModelId: dee852f3c6b348a2b9d5be5dd3244081; ModelTransform: 258.97184,390.1567,0,90,0,0,-35.433,0,0; Type: 1个P沟道; Drain Source Voltage (Vdss): 40V; Continuous Drain Current (Id): 40A; Power Dissipation (Pd): 62.5W; Total Gate Charge (Qg@Vgs): 42nC@10V; Input Capacitance (Ciss@Vds): 2.55nF@20V; Reverse Transfer Capacitance (Crss@Vds): 190pF@20V; Symbol: AOD4185_C400894; LCSC Part Name: 1个P沟道 耐压:40V 电流:40A; SupplierPart: C400894; ManufacturerPart: AOD4185; Supplier Footprint: TO-252(DPAK); JLCPCB Part Class: Extended Part; Datasheet: https://atta.szlcsc.com/upload/public/pdf/source/20190627/C400894_921958B6CB7B7C674397E60AAED89785.pdf; Supplier: LCSC; ConvertToPcb: yes; FootprintName: TO-252-3_L6.6-W6.1-P4.57-LS9.9-BR-CW; ModelName: TO-252-3_L6.6-W6.1-P4.57-LS9.9-BR-CW; Drain Source On Resistance (RDS(on)@Vgs,Id): 20mΩ@4.5V,15A; Gate Threshold Voltage (Vgs(th)@Id): 1.7V@250uA; Operating Temperature: -55℃~+175℃
Q?#5 Q?#6 = 50n04: 数量:1个N沟道;漏源电压(Vdss):40V;连续漏极电流(Id):45A;导通电阻(RDS(on)):11mΩ;耗散功率(Pd):20W;阈值电压(Vgs(th)):2V;; Manufacturer: HL(富海微); AddInBom: yes; ModelId: ce57f84d66384067af8a68020b6de06d; ModelName: TO-252-2L-3P_L6.6-W6.1-H2.3-LS10.1-P4.6; ModelTransform: 259.842,390.52442,0,90,0,0,-39.39,0,0; Number: 1个N沟道; Drain to Source Voltage: 40V; Current - Continuous Drain(Id): 45A; RDS(on): 11mΩ; Pd - Power Dissipation: 20W; Gate Threshold Voltage (Vgs(th)): 2V; Gate Charge(Qg): 22.9nC@10V; Type: N沟道; Symbol: 50N04; LCSC Part Name: 1个N沟道 耐压:40V 电流:45A; SupplierPart: C7543827; ManufacturerPart: 50N04; Supplier Footprint: TO-252; JLCPCB Part Class: Extended Part; Datasheet: https://item.szlcsc.com/datasheet/50N04/8649544.html; Supplier: LCSC; ConvertToPcb: yes; FootprintName: TO-252-2_L6.6-W6.1-P4.57-LS9.9-BR-CW; Operating Temperature: -55℃~+150℃
R?#1-R?#4 R?#6 R?#188 R?#190-R?#192 R?#205 = R-0603-100Ω-5%_13: 片式电阻; 物料描述: 片式电阻器-0805-10KΩ-5%-JT; 物料号: NA
R?#5 R?#117 R?#229 = R-0603-100Ω-5%_16: 片式电阻; 物料描述: 片式电阻器-0805-10KΩ-5%-JT; 物料号: NA
R?#7-R?#10 R?#47 R?#211 = R-0603-100Ω-5%_10: 片式电阻; 物料描述: 片式电阻器-0805-10KΩ-5%-JT; 物料号: NA
R?#11 R?#13 R?#184 R?#187 R?#193-R?#195 R?#203 R?#209 R?#212 R?#214-R?#218 R?#220 R?#221 R?#223 R?#226 R?#227 = R-0603-100Ω-5%_7: 片式电阻; 物料描述: 片式电阻器-0805-10KΩ-5%-JT; 物料号: NA
R?#12 R?#23 R?#28 R?#32 R?#33 R?#36 R?#38 R?#39 R?#49 R?#58 R?#59 = R-0603-100Ω-5%_20: 片式电阻; 物料描述: 片式电阻器-0805-10KΩ-5%-JT; 物料号: NA
R?#14-R?#22 R?#24-R?#27 R?#29-R?#31 R?#34 R?#35 R?#37 R?#40-R?#43 R?#45 R?#48 R?#50-R?#57 R?#60-R?#70 R?#103 R?#107 R?#108 R?#111 R?#115 R?#118 R?#123 R?#125 R?#126 R?#130 R?#131 R?#135 R?#136 R?#138-R?#140 R?#147 = R-0603-100Ω-5%_2: 片式电阻; 物料描述: 片式电阻器-0805-10KΩ-5%-JT; 物料号: NA
R?#44 R?#46 R?#122 R?#189 R?#204 R?#219 = 3296w-1-202lf: 阻值:2kΩ;精度:±10%;功率:500mW;温度系数:±100ppm/℃;; Manufacturer: BOURNS; Symbol: 3296W-1-202LF_C83684; AddInBom: yes; ModelId: 3664f7b541aa4725a8b6d3b7a961f078; ModelTransform: 374.015,188.976,0,90,0,0,2.362,0.005,-137.795; Value: 2kΩ; Tolerance: ±10%; Power(Watts): 500mW; Number of Turns: 25; LCSC Part Name: 2kΩ ±10%; SupplierPart: C83684; ManufacturerPart: 3296W-1-202LF; Supplier Footprint: SIP-3P,9.5x4.8mm; JLCPCB Part Class: Extended Part; Datasheet: https://item.szlcsc.com/datasheet/3296W-1-202LF/84850.html; Supplier: LCSC; ConvertToPcb: yes; FootprintName: RES-ADJ-TH_3296W; ModelName: RES-ADJ-TH_3296W; Temperature Coefficient: ±100ppm/℃
R?#71-R?#80 R?#82-R?#85 R?#87-R?#101 R?#124 R?#127 R?#142-R?#146 R?#148-R?#151 R?#154 R?#156-R?#168 = R-0603-100Ω-5%_15: 片式电阻; 物料描述: 片式电阻器-0805-10KΩ-5%-JT; 物料号: NA
R?#81 R?#86 R?#102 R?#104-R?#106 R?#109 R?#110 R?#112-R?#114 R?#129 R?#132 R?#134 R?#153 R?#155 R?#169-R?#175 R?#177 R?#178 R?#180-R?#183 R?#197-R?#200 R?#213 R?#222 R?#225 = R-0603-100Ω-5%_11: 片式电阻; 物料描述: 片式电阻器-0805-10KΩ-5%-JT; 物料号: NA
R?#116 R?#119-R?#121 R?#141 R?#152 = R-0603-100Ω-5%_4: 片式电阻; 物料描述: 片式电阻器-0805-10KΩ-5%-JT; 物料号: NA
R?#128 R?#133 R?#137 = R-0603-100Ω-5%_9: 片式电阻; 物料描述: 片式电阻器-0805-10KΩ-5%-JT; 物料号: NA
R?#176 R?#179 R?#185 R?#186 R?#196 R?#201 R?#202 R?#206-R?#208 R?#210 R?#224 R?#228 = 0603-1KΩ-5%: 片式电阻; 物料描述: 片式电阻器-0805-10KΩ-5%-JT; 物料号: NA
U?#1 U?#2 = bf256b: 数量:1个N沟道;栅源击穿电压(Vgss):30V;耗散功率(Pd):350mW;导通电阻(RDS(on)):-;漏源电流(Idss):13mA;; Manufacturer: onsemi(安森美); AddInBom: yes; ModelId: 4ec6837dedfb4578a434f76110365bf1; ModelTransform: 180.3146,140.1572,0,180,0,0,0,23.465,-196.85; Number: 1个N沟道; Gate-Source Cutoff Voltage (VGS(off)): 500mV; Gate-Source Breakdown Voltage (Vgss): 30V; Pd - Power Dissipation: 350mW; Drain Current (Idss): 13mA; FET Type: N沟道; Symbol: BF256B; LCSC Part Name: 1个N沟道 500mV@10nA; SupplierPart: C2892081; ManufacturerPart: BF256B; Supplier Footprint: TO-92-3; JLCPCB Part Class: Extended Part; Datasheet: https://item.szlcsc.com/datasheet/BF256B/3122554.html; Supplier: LCSC; ConvertToPcb: yes; FootprintName: TO-92-3_L4.6-W3.9-P1.27-L; ModelName: TO-92-3_L4.6-W3.9-P1.27-L; RDS(on): -; Ciss-Input Capacitance: -; Operating Temperature: -55℃~+150℃; Configuration: -; Output Capacitance(Coss): -; Reverse Transfer Capacitance (Crss): -
ZD?#1-ZD?#5 ZD?#7 ZD?#9 ZD?#10 ZD?#28 ZD?#35 = DIO_ZENER_2: 15V稳压管; Brand: 10V; Part Number: *
ZD?#11 ZD?#12 ZD?#60 = DIO_ZENER_5: 18V稳压管; Brand: 10V; Part Number: *
ZD?#32 = DIO_ZENER_4: 10V稳压管; Brand: 10V; Part Number: *
ZD?#66 = DIO_ZENER_6: 9V稳压管; Brand: 10V; Part Number: *
N?#1 N?#3 N?#6 N?#8 N?#9 N?#13 N?#14 N?#18 N?#21 N?#22 N?#24 N?#25 N?#27 N?#29-N?#35 N?#38-N?#52 N?#54-N?#58 N?#60 N?#62 N?#65 N?#67 N?#68 N?#70-N?#72 N?#74 N?#75 N?#77-N?#80 N?#82 N?#84 N?#85 N?#88 N?#91 N?#92 N?#95 N?#96 N?#98-N?#100 N?#102 N?#104-N?#108 N?#110-N?#114 N?#116 N?#117 N?#119-N?#121 N?#123-N?#127 N?#129 N?#131 N?#133 N?#134 N?#137-N?#142 N?#144 N?#146 N?#149-N?#154 N?#157 N?#158 N?#160-N?#164 N?#166 N?#170 N?#171 N?#175-N?#182 N?#184 N?#186 N?#187 N?#190 N?#192 N?#193 N?#195 N?#196 N?#198 N?#199 Q?#3 Q?#4 = MMTB3904: Part Number: *; Brand: *
P?#1-P?#9 P?#11-P?#48 Q?#7-Q?#9 = MMBT3906: Part Number: *; Brand: *